# Altium project QR SCANNER.PrjPcb
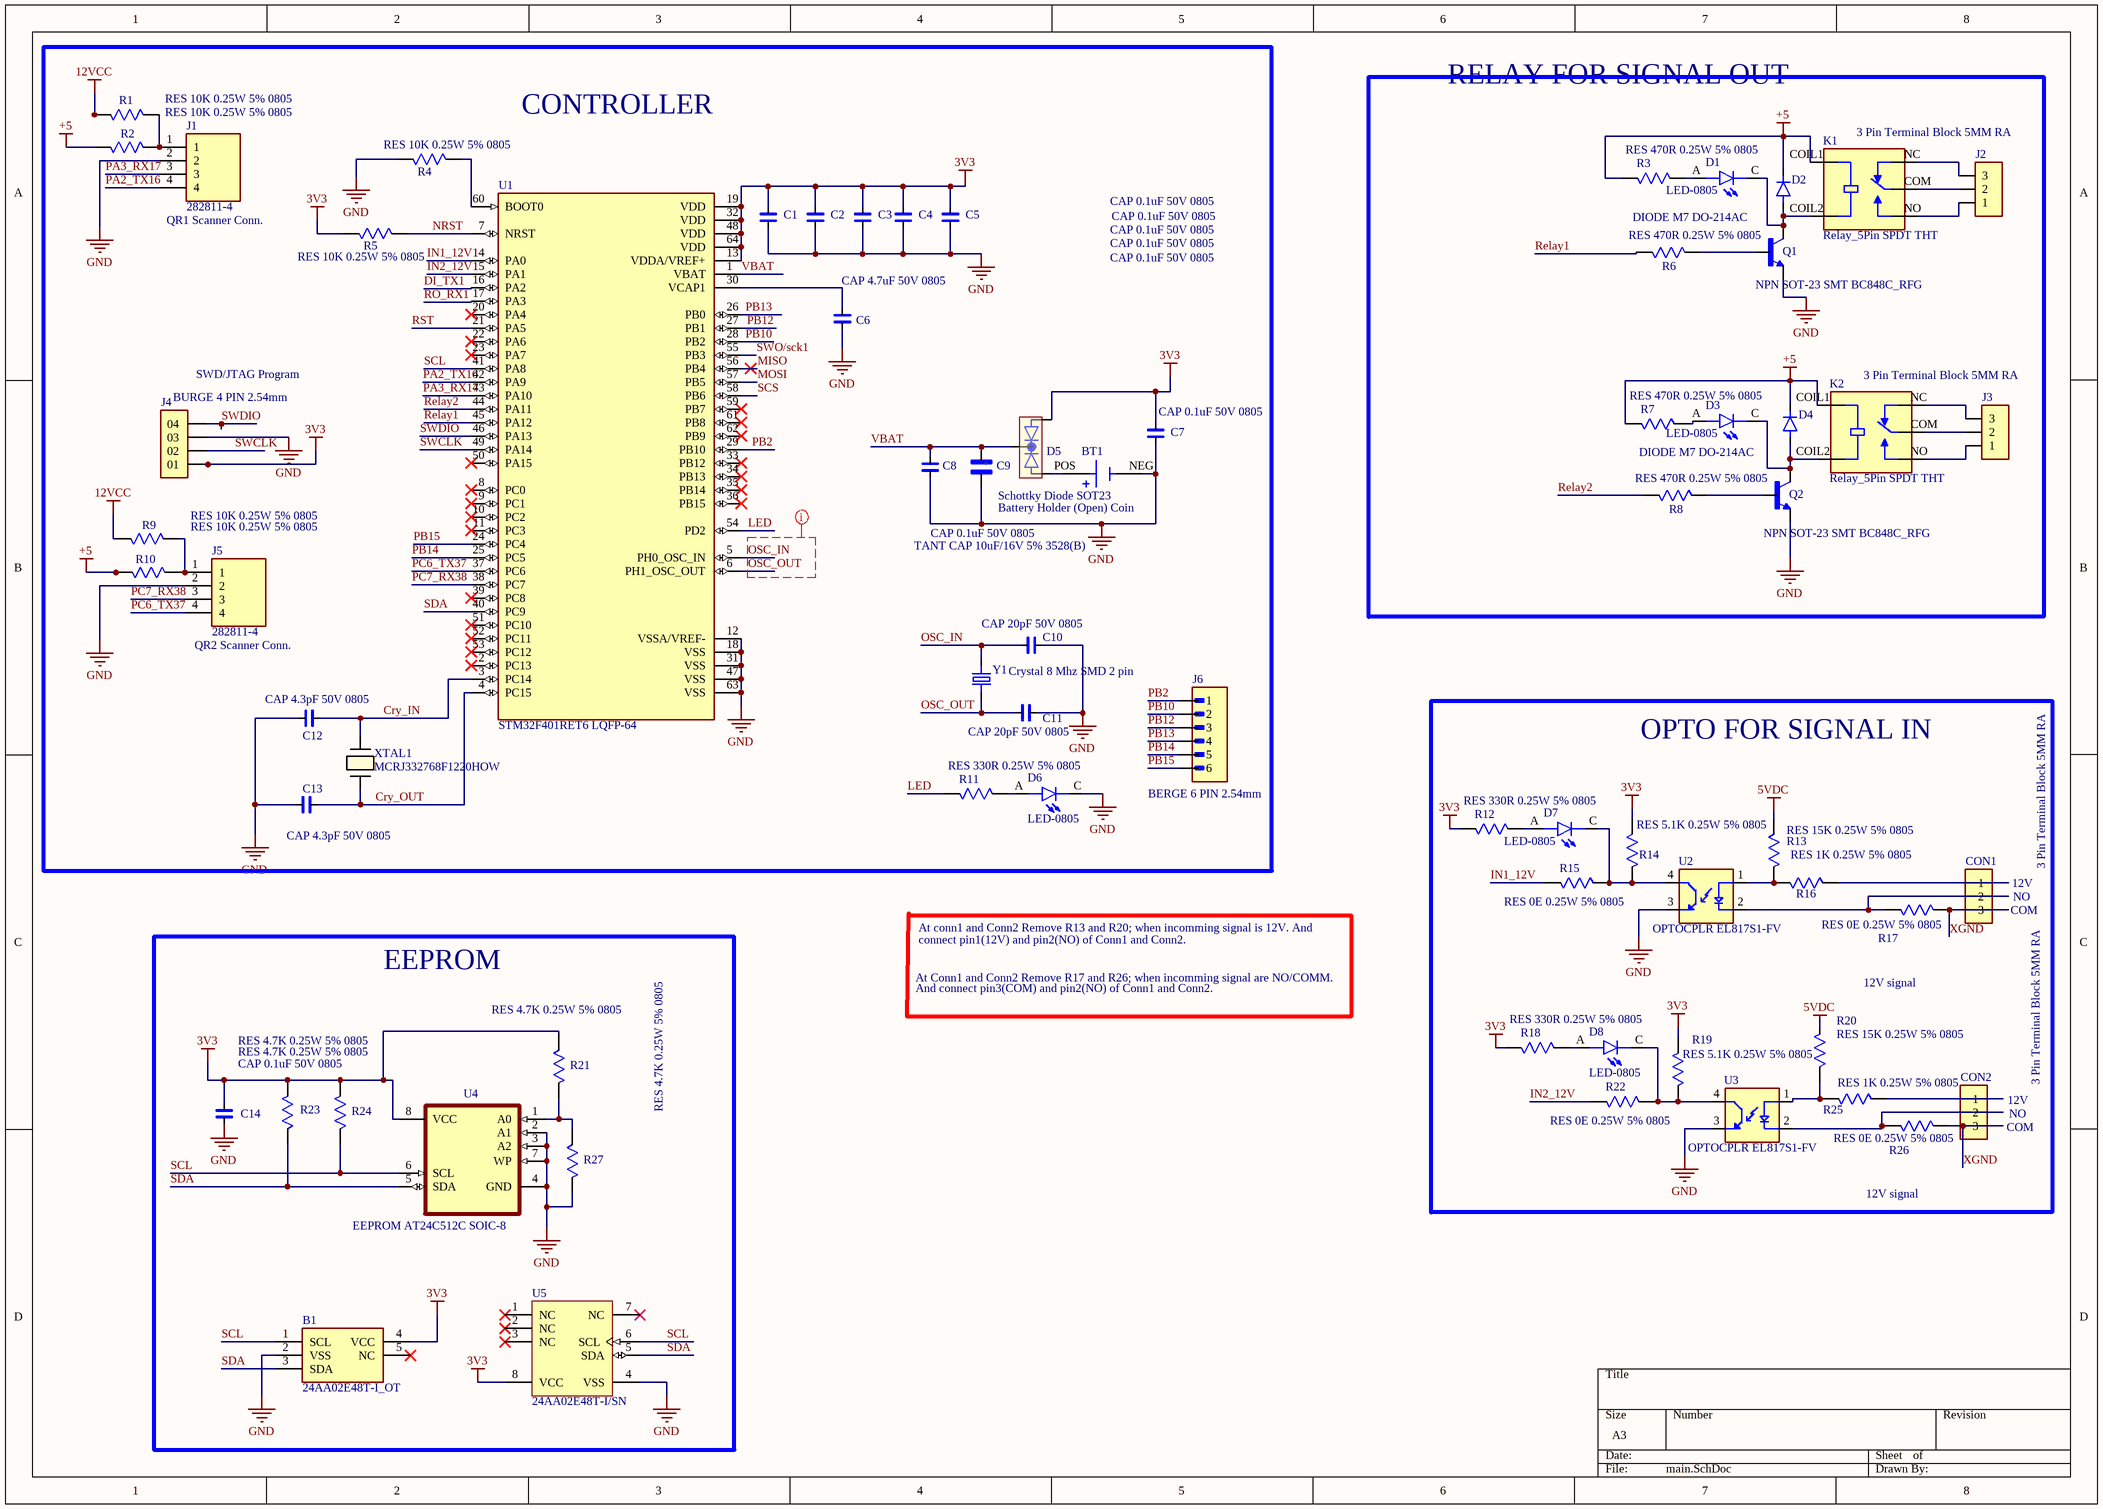
[diagram p0: main.SchDoc]
3 sheets, 158 parts. Net scope: global (net labels, ports and power ports of the same name join across sheets).
Board file: QR SCANNER NEW.PcbDoc
Sheets:
  main.SchDoc
  LAN 485.SchDoc
  Power.SchDoc

## Sheet main.SchDoc
size A3; SheetNumber: 1; SheetTotal: 3

### Parts
B1  24AA02E48T-I_OT  [SOT95P270X145-5N]
BT1  Battery Holder (Open) Coin  [Battery Holder (Open) Coin]
C1  CAP 0.1uF 50V 0805  [CAP CER 0.1uF/50V 5%]
C2  CAP 0.1uF 50V 0805  [CAP CER 0.1uF/50V 5%]
C3  CAP 0.1uF 50V 0805  [CAP CER 0.1uF/50V 5%]
C4  CAP 0.1uF 50V 0805  [CAP CER 0.1uF/50V 5%]
C5  CAP 0.1uF 50V 0805  [CAP CER 0.1uF/50V 5%]
C6  CAP 4.7uF 50V 0805  [CAP CER 0.1uF/50V 5%]
C7  CAP 0.1uF 50V 0805  [CAP CER 0.1uF/50V 5%]
C8  CAP 0.1uF 50V 0805  [CAP CER 0.1uF/50V 5%]
C9  TANT CAP 10uF/16V 5% 3528(B)  [TANT CAP 3528(B)]
C10  CAP 20pF 50V 0805  [CAP CER 0.1uF/50V 5%]
C11  CAP 20pF 50V 0805  [CAP CER 0.1uF/50V 5%]
C12  CAP 4.3pF 50V 0805  [CAP CER 0.1uF/50V 5%]
C13  CAP 4.3pF 50V 0805  [CAP CER 0.1uF/50V 5%]
C14  CAP 0.1uF 50V 0805  [CAP CER 0.1uF/50V 5%]
CON1  3 Pin Terminal Block 5MM RA  [3 Pin Terminal Block 5MM RA]
CON2  3 Pin Terminal Block 5MM RA  [3 Pin Terminal Block 5MM RA]
D1  LED-0805  [LED-0805]
D2  DIODE M7 DO-214AC  [DIODE M7 DO-214AC]
D3  LED-0805  [LED-0805]
D4  DIODE M7 DO-214AC  [DIODE M7 DO-214AC]
D5  Schottky Diode SOT23  [Schottky Diode SOT23 BAT54C]
D6  LED-0805  [LED-0805]
D7  LED-0805  [LED-0805]
D8  LED-0805  [LED-0805]
J1  282811-4  [TE_282811-4]
J2  3 Pin Terminal Block 5MM RA  [3 Pin Terminal Block 5MM RA]
J3  3 Pin Terminal Block 5MM RA  [3 Pin Terminal Block 5MM RA]
J4  BURGE 4 PIN 2.54mm  [BURGE 4 PIN 2.54mm]
J5  282811-4  [TE_282811-4]
J6  BERGE 6 PIN 2.54mm  [BERGE 6 PIN 2.54mm]
K1  Relay_5Pin SPDT THT  [Relay_5Pin SPDT THT]
K2  Relay_5Pin SPDT THT  [Relay_5Pin SPDT THT]
Q1  NPN SOT-23 SMT BC848C_RFG  [NPN SOT-23 SMT BC848C_RFG]
Q2  NPN SOT-23 SMT BC848C_RFG  [NPN SOT-23 SMT BC848C_RFG]
R1  RES 10K 0.25W 5% 0805  [RES 0805 10K/0.25W 5%]
R2  RES 10K 0.25W 5% 0805  [RES 0805 10K/0.25W 5%]
R3  RES 470R 0.25W 5% 0805  [RES 0805 10K/0.25W 5%]
R4  RES 10K 0.25W 5% 0805  [RES 0805 10K/0.25W 5%]
R5  RES 10K 0.25W 5% 0805  [RES 0805 10K/0.25W 5%]
R6  RES 470R 0.25W 5% 0805  [RES 0805 10K/0.25W 5%]
R7  RES 470R 0.25W 5% 0805  [RES 0805 10K/0.25W 5%]
R8  RES 470R 0.25W 5% 0805  [RES 0805 10K/0.25W 5%]
R9  RES 10K 0.25W 5% 0805  [RES 0805 10K/0.25W 5%]
R10  RES 10K 0.25W 5% 0805  [RES 0805 10K/0.25W 5%]
R11  RES 330R 0.25W 5% 0805  [RES 0805 10K/0.25W 5%]
R12  RES 330R 0.25W 5% 0805  [RES 0805 10K/0.25W 5%]
R13  RES 15K 0.25W 5% 0805  [RES 0805 10K/0.25W 5%]
R14  RES 5.1K 0.25W 5% 0805  [RES 0805 10K/0.25W 5%]
R15  RES 0E 0.25W 5% 0805  [RES 0805 10K/0.25W 5%]
R16  RES 1K 0.25W 5% 0805  [RES 0805 10K/0.25W 5%]
R17  RES 0E 0.25W 5% 0805  [RES 0805 10K/0.25W 5%]
R18  RES 330R 0.25W 5% 0805  [RES 0805 10K/0.25W 5%]
R19  RES 5.1K 0.25W 5% 0805  [RES 0805 10K/0.25W 5%]
R20  RES 15K 0.25W 5% 0805  [RES 0805 10K/0.25W 5%]
R21  RES 4.7K 0.25W 5% 0805  [RES 0805 10K/0.25W 5%]
R22  RES 0E 0.25W 5% 0805  [RES 0805 10K/0.25W 5%]
R23  RES 4.7K 0.25W 5% 0805  [RES 0805 10K/0.25W 5%]
R24  RES 4.7K 0.25W 5% 0805  [RES 0805 10K/0.25W 5%]
R25  RES 1K 0.25W 5% 0805  [RES 0805 10K/0.25W 5%]
R26  RES 0E 0.25W 5% 0805  [RES 0805 10K/0.25W 5%]
R27  RES 4.7K 0.25W 5% 0805  [RES 0805 10K/0.25W 5%]
U1  STM32F401RET6 LQFP-64  [STM32F401RE Cortex-M4]
U2  OPTOCPLR EL817S1-FV  [OPTOCPLR EL817S1-FV]
U3  OPTOCPLR EL817S1-FV  [OPTOCPLR EL817S1-FV]
U4  EEPROM AT24C512C SOIC-8  [EEPROM AT24C512C SOIC-8]
U5  24AA02E48T-I/SN  [SOIC-SN8_N]
XTAL1  MCRJ332768F1220HOW  [CRYSTAL_MCRJ332768F1220HOW_MTC]
Y1  Crystal 8 Mhz SMD 2 pin  [Crystal 16 Mhz SMD 2 pin]

### Blocks framed on the sheet
CONTROLLER: BT1 C1-C13 D5 D6 J1 J4-J6 R1 R2 R4 R5 R9-R11 U1 XTAL1 Y1
RELAY FOR SIGNAL OUT: D1-D4 J2 J3 K1 K2 Q1 Q2 R3 R6-R8
OPTO FOR SIGNAL IN: CON1 CON2 D7 D8 R12-R20 R22 R25 R26 U2 U3
EEPROM: B1 C14 R21 R23 R24 R27 U4 U5

### Nets
3V3: B1.4(VCC) C1.2 C2.2 C3.2 C4.2 C5.2 C7.2 C14.2 D5.1(A1) J4.01 R5.1 R12.2 R14.1 R18.2 R19.1 R21.2 R23.2 R24.2 U1.13(VDDA/VREF+) U1.19(VDD) U1.32(VDD) U1.48(VDD) U1.64(VDD) U4.8(VCC) U5.8(VCC)
5VDC: R13.1 R20.1
12VCC: R1.1 R9.1
+5: D2.C(K) D4.C(K) K1.COIL1 K2.COIL1 R2.1 R3.2 R7.2 R10.1
GND: B1.2(VSS) BT1.NEG C1.1 C2.1 C3.1 C4.1 C5.1 C6.1 C7.1 C8.1 C9.2 C10.2 C11.2 C12.2 C13.2 C14.1 D6.C J1.2 J4.03 J5.2 Q1.2(E) Q2.2(E) R4.1 R27.1 U1.12(VSSA/VREF-) U1.18(VSS) U1.31(VSS) U1.47(VSS) U1.63(VSS) U2.3(ET) U3.3(ET) U4.2(A1) U4.3(A2) U4.4(GND) U4.7(WP) U5.4(VSS)
Cry_IN: C12.1 U1.3(PC14) XTAL1.1
Cry_OUT: C13.1 U1.4(PC15) XTAL1.2
DI_TX1: U1.16(PA2)
IN1_12V: R15.2 U1.14(PA0)
IN2_12V: R22.2 U1.15(PA1)
LED: R11.2 U1.54(PD2)
MISO: U1.56(PB4)
MOSI: U1.57(PB5)
NRST: R5.2 U1.7(NRST)
OSC_IN: C10.1 U1.5(PH0_OSC_IN) Y1.2
OSC_OUT: C11.1 U1.6(PH1_OSC_OUT) Y1.1
PA2_TX16: J1.4 U1.42(PA9)
PA3_RX17: J1.3 U1.43(PA10)
PB2: J6.1 U1.29(PB10)
PB10: J6.2 U1.28(PB2)
PB12: J6.3 U1.27(PB1)
PB13: J6.4 U1.26(PB0)
PB14: J6.5 U1.25(PC5)
PB15: J6.6 U1.24(PC4)
PC6_TX37: J5.4 U1.37(PC6)
PC7_RX38: J5.3 U1.38(PC7)
Relay1: R6.1 U1.45(PA12)
Relay2: R8.1 U1.44(PA11)
RO_RX1: U1.17(PA3)
RST: U1.21(PA5)
SCL: B1.1(SCL) R24.1 U1.41(PA8) U4.6(SCL) U5.6(SCL)
SCS: U1.58(PB6)
SDA: B1.3(SDA) R23.1 U1.40(PC9) U4.5(SDA) U5.5(SDA)
SWCLK: J4.02 U1.49(PA14)
SWDIO: J4.04 U1.46(PA13)
SWO/sck1: U1.55(PB3)
VBAT: C8.2 C9.1 D5.3(C) U1.1(VBAT)
XGND: CON1.3 CON2.3 R17.1 R26.1
NetBT1_POS: BT1.POS D5.2(A2)
NetC6_2: C6.2 U1.30(VCAP1)
NetCON1_1: CON1.1 R16.1
NetCON1_2: CON1.2 R17.2 U2.2(C)
NetCON2_1: CON2.1 R25.1
NetCON2_2: CON2.2 R26.2 U3.2(C)
NetD1_A: D1.A R3.1
NetD1_C: D1.C D2.A K1.COIL2 Q1.3(C)
NetD3_A: D3.A R7.1
NetD3_C: D3.C D4.A K2.COIL2 Q2.3(C)
NetD6_A: D6.A R11.1
NetD7_A: D7.A R12.1
NetD7_C: D7.C R14.2 R15.1 U2.4(CT)
NetD8_A: D8.A R18.1
NetD8_C: D8.C R19.2 R22.1 U3.4(CT)
NetJ1_1: J1.1 R1.2 R2.2
NetJ2_1: J2.1 K1.NO
NetJ2_2: J2.2 K1.COM
NetJ2_3: J2.3 K1.NC
NetJ3_1: J3.1 K2.NO
NetJ3_2: J3.2 K2.COM
NetJ3_3: J3.3 K2.NC
NetJ5_1: J5.1 R9.2 R10.2
NetQ1_1: Q1.1(B) R6.2
NetQ2_1: Q2.1(B) R8.2
NetR4_2: R4.2 U1.60(BOOT0)
NetR13_2: R13.2 R16.2 U2.1(A)
NetR20_2: R20.2 R25.2 U3.1(A)
NetR21_1: R21.1 R27.2 U4.1(A0)

Not connected (* = marked no-connect by the designer): B1 5(NC)*; U1 2(PC13)* 8(PC0)* 9(PC1)* 10(PC2)* 11(PC3)* 20(PA4)* 22(PA6)* 23(PA7)* 33(PB12)* 34(PB13)* 35(PB14)* 36(PB15)* 39(PC8)* 50(PA15)* 51(PC10)* 52(PC11)* 53(PC12)* 59(PB7)* 61(PB8)* 62(PB9)*; U5 1(NC)* 2(NC)* 3(NC)* 7(NC)*

### Layout directives
net class Single_50 ohm: OSC_IN, OSC_OUT

### Notes on the sheet
- (near J1) QR1 Scanner Conn.
- (near J4) SWD/JTAG Program
- (near J5) QR2 Scanner Conn.
- (near CON1) COM
- (near CON1) 12V
- (near CON1) NO
- At Conn1 and Conn2 Remove R17 and R26; when incomming signal are NO/COMM.
- And connect pin3(COM) and pin2(NO) of Conn1 and Conn2.
- At conn1 and Conn2 Remove R13 and R20; when incomming signal is 12V. And
- connect pin1(12V) and pin2(NO) of Conn1 and Conn2.
- 12V signal
- (near CON2) 12V
- (near CON2) NO
- (near CON2) COM
- (in symbol TANT CAP 10uF/16V 5% 3528(B)) +

### Library data of the parts
B1 = 24AA02E48T-I_OT: 2K 256X8 1.8V Ser.EEPROM,24AA02E48T-I/OT; Manufacturer_Name: Microchip; Geometry.Height: 1.45mm; Manufacturer_Part_Number: 24AA02E48T-I/OT; Mouser Part Number: 579-24AA02E48TIOT; Mouser Price/Stock: https://www.mouser.co.uk/ProductDetail/Microchip-Technology/24AA02E48T-I-OT?qs=h8kCHL4kpM5dzsPTuTrxSQ%3D%3D; Arrow Part Number: 24AA02E48T-I/OT; Arrow Price/Stock: https://www.arrow.com/en/products/24aa02e48t-iot/microchip-technology?utm_currency=USD&region=nac; Datasheet Link: https://datasheet.datasheetarchive.com/originals/distributors/SFDatasheet-11/sf-000234844.pdf
BT1 = Battery Holder (Open) Coin: Battery Holder (Open) Coin, 20.0mm 1 Cell SMD (SMT) Tab, CR2032, BS-7-RED; Package: None; Price: None; Value: *; MP: BS-7-RED; Availability: Unavailable
C1-C8 C10-C14 = CAP CER 0.1uF/50V 5%: CAP CER 0.1uF/50V  Ceramic Capacitor X7R 0805 (2012 Metric) SMT; MF: Samsung; MP: CL21B104KCFNNNE; Purchase-URL: https://pricing.snapeda.com/search?q=CL21B104KCFNNNE&ref=eda; Package: 0805 Samsung; Check_prices: https://www.snapeda.com/parts/CL21B104KCFNNNE/Samsung+Electro-Mechanics/view-part/?ref=eda; Value: *; SnapEDA_Link: https://www.snapeda.com/parts/CL21B104KCFNNNE/Samsung+Electro-Mechanics/view-part/?ref=snap; Digi-Key_Part_Number: 1276-6840-2-ND
C9 = TANT CAP 10uF/16V 5% 3528(B): 10 ÂµF Molded Tantalum Polymer Capacitor 25 V 1411 (3528 Metric), 1210 150mOhm TCJB106M025R0150; MF: AVX; SnapEDA_Link: https://www.snapeda.com/parts/TCJB106M025R0150/AVX/view-part/?ref=snap; Package: 1210 AVX; Value: *; MP: TCJB106M025R0150; Check_prices: https://www.snapeda.com/parts/TCJB106M025R0150/AVX/view-part/?ref=eda
CON1 CON2 J2 J3 = 3 Pin Terminal Block 5MM RA: 3 Pin Terminal Block HDR 5MM THT RA 231-433_001-000; MP: 231-433/001-000; MF: WAGO; SnapEDA_Link: https://www.snapeda.com/parts/231-433/001-000/WAGO/view-part/482062/?ref=snap; Package: None; Availability: Unavailable; Price: None; Value: *
D1 D3 D6-D8 = LED-0805: Red 640nm LED Indication - Discrete 1.85V 0805 (2012 Metric) APT2012SRCPRV; MF: Kingbright; SnapEDA_Link: https://www.snapeda.com/parts/APT2012SRCPRV/Kingbright/view-part/?ref=snap; Package: 0805 Kingbright; Value: *; MP: APT2012SRCPRV; Check_prices: https://www.snapeda.com/parts/APT2012SRCPRV/Kingbright/view-part/?ref=eda
D2 D4 = DIODE M7 DO-214AC: M7 General Purpose SMD Rectifier Diode SMA (DO-214AC) 1A 1000V 1n4007 RS2MA; MF: Taiwan Semiconductor; SnapEDA_Link: https://www.snapeda.com/parts/RS2MA/Taiwan+Semiconductor/view-part/?ref=snap; Package: DO-214AC-2 Taiwan Semiconductor; Value: *; MP: RS2MA; Check_prices: https://www.snapeda.com/parts/RS2MA/Taiwan+Semiconductor/view-part/?ref=eda
D5 = Schottky Diode SOT23 BAT54C: Schottky Diode 2x ComCath 0.2A 30V SOT23 | Diodes Inc BAT54C; MF: Diodes Inc.; MP: BAT54C-7-F; SnapEDA_Link: https://www.snapeda.com/parts/BAT54C-7-F/Diodes+Inc./view-part/?ref=snap; Package: SOT-23 Diodes Inc.; Value: *; Check_prices: https://www.snapeda.com/parts/BAT54C-7-F/Diodes+Inc./view-part/?ref=eda
J1 J5 = 282811-4: 4 Position Terminal Block Header, Male Pins, Shrouded (2 Side) 0.197 (5.00mm) 90Â°, Right Angle Through Hole; Centerline_Pitch: 5 mm[.197 in]; MF: TE Connectivity; Number_of_Positions: 4; SnapEDA_Link: https://www.snapeda.com/parts/282811-4/TE%20Connectivity%20AMP%20Connectors/view-part/2383458/?ref=snap; Price: None; Mouser-Purchase-URL: https://snapeda.com/shop?store=Mouser&id=2383458; DigiKey-Purchase-URL: https://snapeda.com/shop?store=DigiKey&id=2383458; Value: *; MP: 282811-4; Package: None; EU_RoHS_Compliance: Compliant; Availability: Good
J4 = BURGE 4 PIN 2.54mm: Conn Unshrouded Header HDR 4 POS 2.54mm Solder ST Top Entry Thru-Hole Bulk TSW-104-17-G-S-LL; MF: Samtec; MP: TSW-104-23-H-S-LL; SnapEDA_Link: https://www.snapeda.com/parts/TSW-104-23-H-S-LL/Samtec/view-part/?ref=snap; Package: None; Value: *; Check_prices: https://www.snapeda.com/parts/TSW-104-23-H-S-LL/Samtec/view-part/?ref=eda
J6 = BERGE 6 PIN 2.54mm: BergStik, Board to Board connector, Unshrouded Vertical Header, Through Hole, Single Row, 6 Positions, 2.54 mm (0.100in) Pitch. 68604-406HLF; MF: AMPHENOL ICC / FCI; SnapEDA_Link: https://www.snapeda.com/parts/68604-406HLF/Amphenol/view-part/?ref=snap; Package: None; Value: *; MP: 68604-406HLF; Check_prices: https://www.snapeda.com/parts/68604-406HLF/Amphenol/view-part/?ref=eda
K1 K2 = Relay_5Pin SPDT THT: Relays General Purpose Non Latching 3VDC SPDT 10A (250VAC) Max 5PIN SRD-03VDC-SL-C; MF: Songle Relay; SnapEDA_Link: https://www.snapeda.com/parts/SRD-03VDC-SL-C/Songle+Relay/view-part/?ref=snap; Package: NON STANDARD-5 Songle Relay; Value: *; MP: SRD-03VDC-SL-C; Check_prices: https://www.snapeda.com/parts/SRD-03VDC-SL-C/Songle+Relay/view-part/?ref=eda
Q1 Q2 = NPN SOT-23 SMT BC848C_RFG: NPN SMT BC848C_RFG SOT-23, 30V, 0.1A, NPN Transistor; MF: Taiwan Semiconductor; MP: BC848C RFG; SnapEDA_Link: https://www.snapeda.com/parts/BC848C%20RFG/Taiwan+Semiconductor/view-part/?ref=snap; Package: SOT-23 Taiwan Semiconductor; Value: *; Check_prices: https://www.snapeda.com/parts/BC848C%20RFG/Taiwan+Semiconductor/view-part/?ref=eda
R1-R27 = RES 10K 0.25W 5% 0805: RESISTOR, THICK FILM, 10K, 5%, 0805 0.25W SMT; MP: ERJ-6GEYJ103V; MF: Panasonic Electronic; Price: None; Check_prices: https://www.snapeda.com/parts/ERJ-6GEYJ103V/Panasonic+Electronic+Components/view-part/?ref=eda; Package: 805-2 Panasonic; Purchase-URL: https://pricing.snapeda.com/search/part/ERJ-6GEYJ103V/?ref=eda; Availability: In Stock; SnapEDA_Link: https://www.snapeda.com/parts/ERJ-6GEYJ103V/Panasonic+Electronic+Components/view-part/?ref=snap; Value: *
U1 = STM32F401RET6: ARMÂ® CortexÂ®-M4 STM32F4 Microcontroller IC 32-Bit Single-Core 84MHz 512KB (512K x 8) FLASH 64-LQFP (10x10); MF: STMicroelectronics; SnapEDA_Link: https://www.snapeda.com/parts/STM32F401RET6/STMicroelectronics/view-part/?ref=snap; Package: LQFP-64 STMicroelectronics; Value: *; MP: STM32F401RET6; Check_prices: https://www.snapeda.com/parts/STM32F401RET6/STMicroelectronics/view-part/?ref=eda
U2 U3 = Optclr EL817S1-FV: Optoisoltr 5kv Transistor 4-Smd EL817S1-FV; MF: {'manufacturer': u'Everlight Electronics Co Ltd'}; MP: EL817S1(A)(TU)-V; Package: None; Price: None; Value: *; Availability: Unavailable
U4 = EEPROM AT24C512C SOIC-8: EEPROM Memory IC 512Kb (64K x 8) IÂ²C 400 kHz 900 ns SOIC-8 AT24C512C-SSHM-T; MF: Microchip; SnapEDA_Link: https://www.snapeda.com/parts/AT24C512C-SSHM-T/Microchip/view-part/?ref=snap; Package: SO-8 Microchip; Value: *; MP: AT24C512C-SSHM-T; Check_prices: https://www.snapeda.com/parts/AT24C512C-SSHM-T/Microchip/view-part/?ref=eda
U5 = CMP-0159-00177-1: 2Kbit, 400kHz, 1.7V, I2C Serial EEPROM with EUI-48 Node Identity, 8-Pin SOIC 150mil, Industrial Temperature, Tape and Reel; PackageReference: SOIC-SN8; DatasheetVersion: revB, Jan-2009; PackageDescription: 8-Lead Plastic Small Outline (SN) - Narrow, 3.90mm Body [SOIC]; PackageVersion: revBB, Aug-2009; Code_IPC: SOIC127P600-8; Code_JEDEC: MS-012
XTAL1 = MCRJ332768F1220HOW: No Description Available; Manufacturer_Name: Multicomp; Copyright: Copyright (C) 2026 Ultra Librarian. All rights reserved.; Manufacturer_Part_Number: MCRJ332768F1220HOW
Y1 = Crystal 16 Mhz SMD 2 pin_1: 16 MHz Â±30ppm Crystal 20pF 60 Ohms HC-49/US FOXSDLF/128-20 16 Mhz Crystal SMD –CSM-4ALX(28ALX) 12.5mmX4.85mmX4mm; MF: Fox Electronics; SnapEDA_Link: https://www.snapeda.com/parts/FOXSDLF/128-20/Fox+Electronics/view-part/?ref=snap; Package: HC49SD Fox Electronics; Value: *; MP: FOXSDLF/128-20; Check_prices: https://www.snapeda.com/parts/FOXSDLF/128-20/Fox+Electronics/view-part/?ref=eda

## Sheet LAN 485.SchDoc
size A3; SheetNumber: 2; SheetTotal: 3
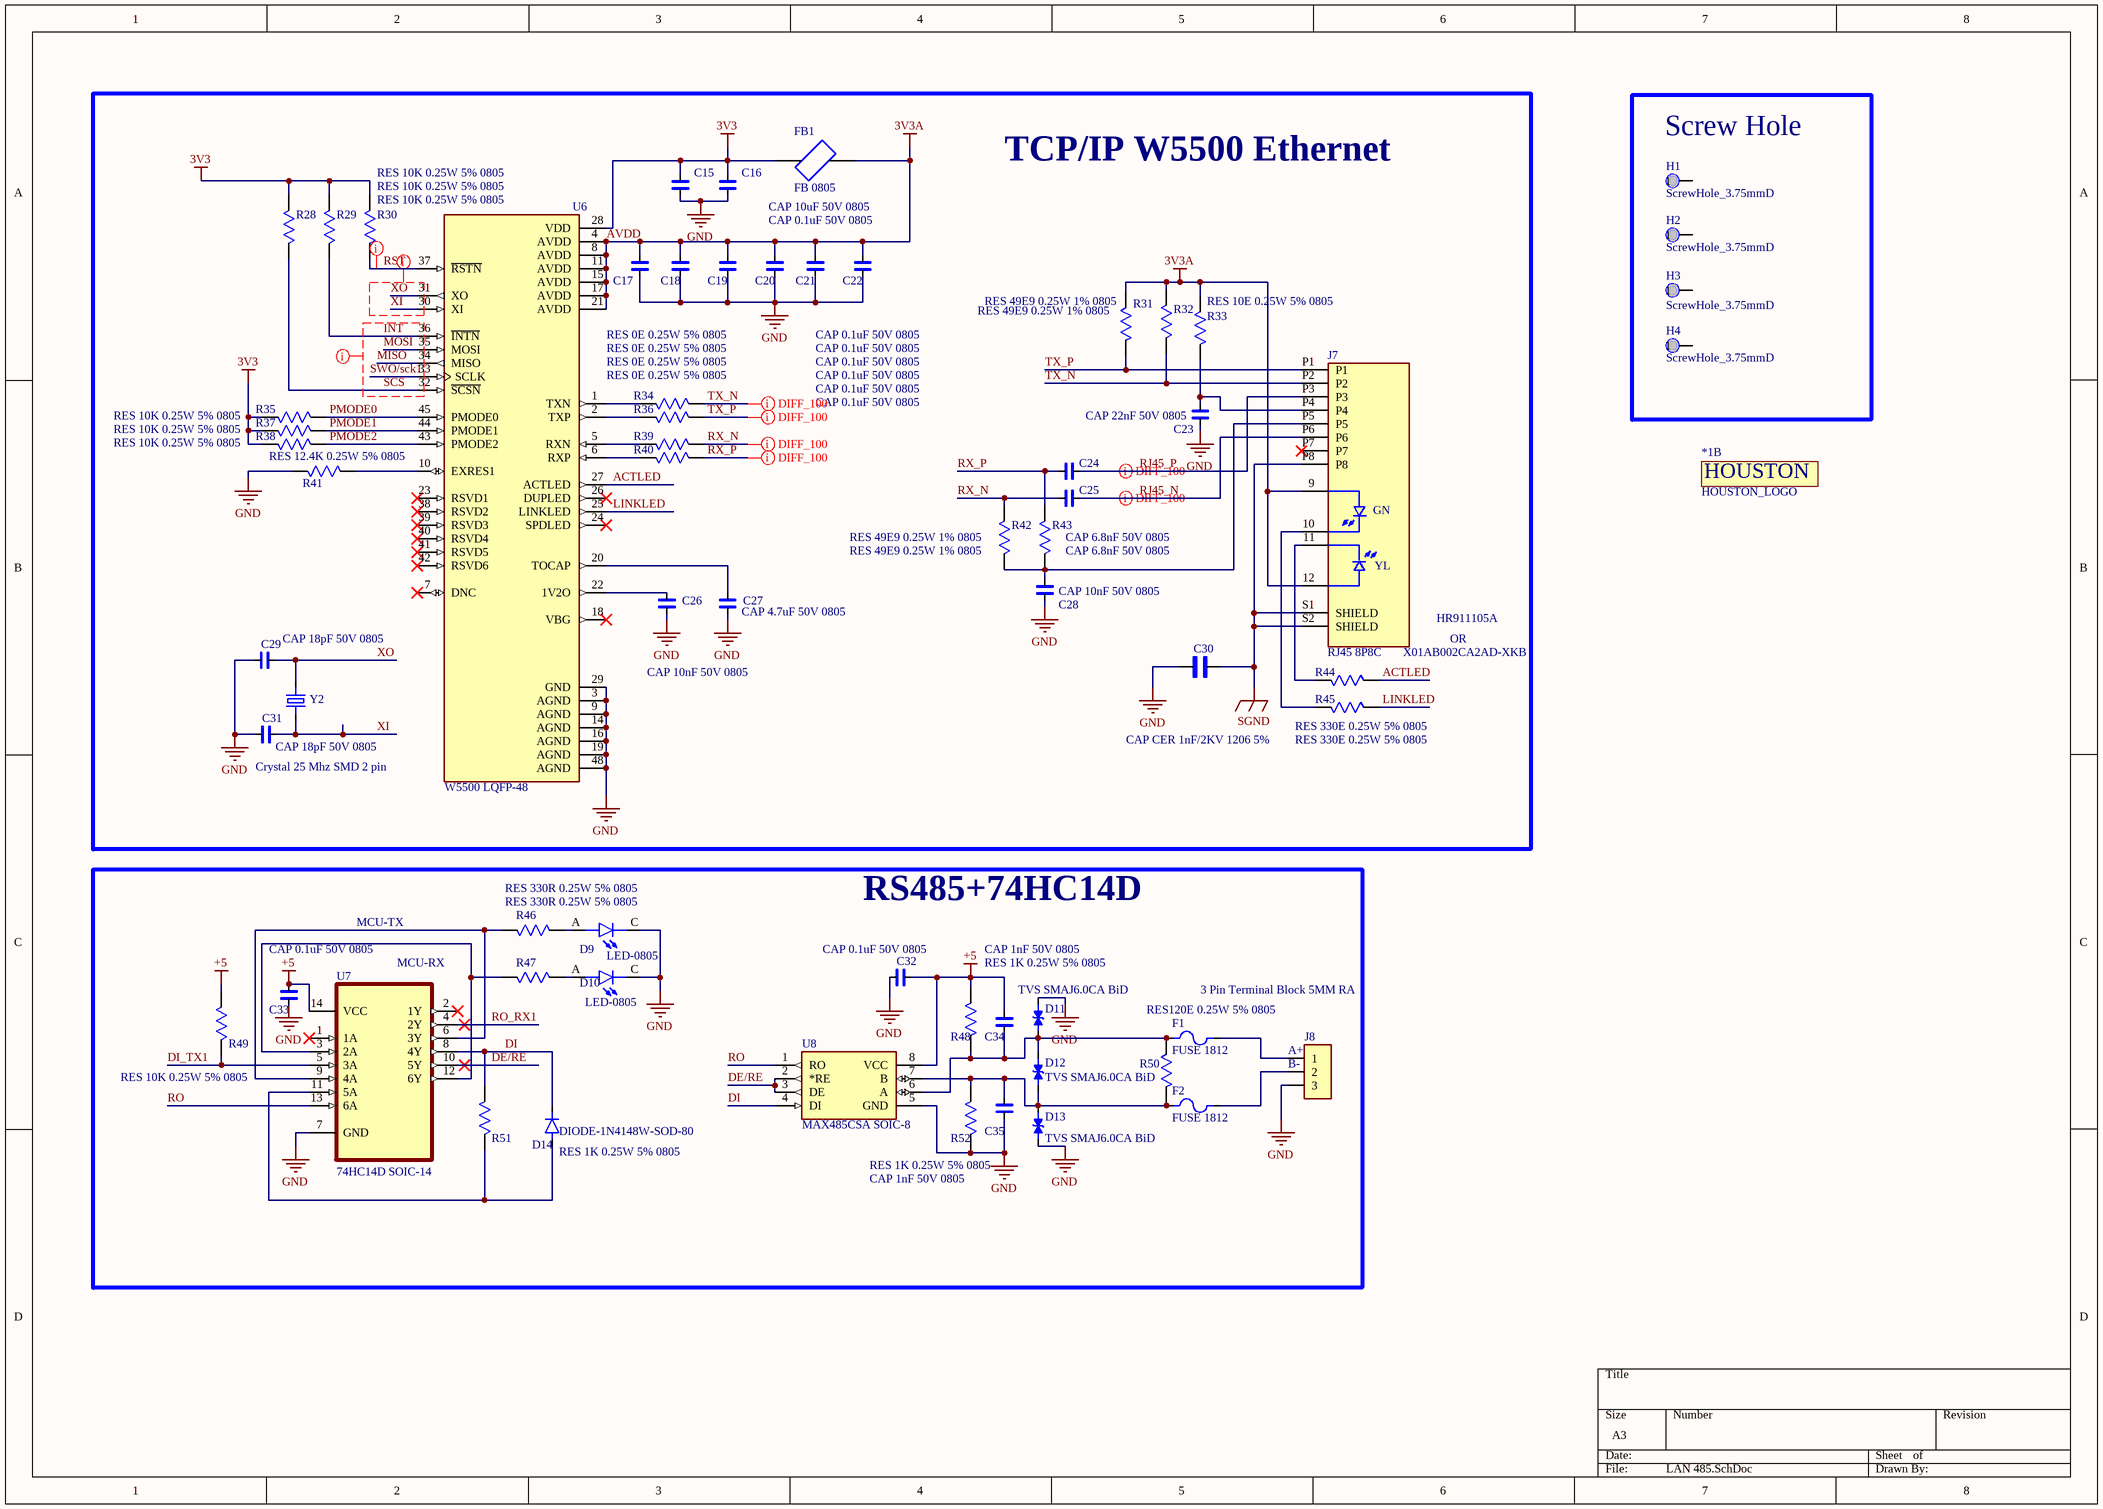
[diagram p1: LAN 485.SchDoc]

### Parts
*1  HOUSTON_LOGO  [HOUSTON_LOGO]  (part B of 2)
C15  CAP 0.1uF 50V 0805  [CAP CER 0.1uF/50V 5%]
C16  CAP 10uF 50V 0805  [CAP CER 0.1uF/50V 5%]
C17  CAP 0.1uF 50V 0805  [CAP CER 0.1uF/50V 5%]
C18  CAP 0.1uF 50V 0805  [CAP CER 0.1uF/50V 5%]
C19  CAP 0.1uF 50V 0805  [CAP CER 0.1uF/50V 5%]
C20  CAP 0.1uF 50V 0805  [CAP CER 0.1uF/50V 5%]
C21  CAP 0.1uF 50V 0805  [CAP CER 0.1uF/50V 5%]
C22  CAP 0.1uF 50V 0805  [CAP CER 0.1uF/50V 5%]
C23  CAP 22nF 50V 0805  [CAP CER 0.1uF/50V 5%]
C24  CAP 6.8nF 50V 0805  [CAP CER 0.1uF/50V 5%]
C25  CAP 6.8nF 50V 0805  [CAP CER 0.1uF/50V 5%]
C26  CAP 10nF 50V 0805  [CAP CER 0.1uF/50V 5%]
C27  CAP 4.7uF 50V 0805  [CAP CER 0.1uF/50V 5%]
C28  CAP 10nF 50V 0805  [CAP CER 0.1uF/50V 5%]
C29  CAP 18pF 50V 0805  [CAP CER 0.1uF/50V 5%]
C30  CAP CER 1nF/2KV 1206 5%  [CAP CER 1nF/2KV 1206 5%]
C31  CAP 18pF 50V 0805  [CAP CER 0.1uF/50V 5%]
C32  CAP 0.1uF 50V 0805  [CAP CER 0.1uF/50V 5%]
C33  CAP 0.1uF 50V 0805  [CAP CER 0.1uF/50V 5%]
C34  CAP 1nF 50V 0805  [CAP CER 0.1uF/50V 5%]
C35  CAP 1nF 50V 0805  [CAP CER 0.1uF/50V 5%]
D9  LED-0805  [LED-0805]
D10  LED-0805  [LED-0805]
D11  TVS SMAJ6.0CA BiD  [TVS SMAJ6.0CA DO-214AC (SMA)]
D12  TVS SMAJ6.0CA BiD  [TVS SMAJ6.0CA DO-214AC (SMA)]
D13  TVS SMAJ6.0CA BiD  [TVS SMAJ6.0CA DO-214AC (SMA)]
D14  DIODE-1N4148W-SOD-80  [DIODE-1N4148W-SOD-80]
F1  FUSE 1812  [FUSE 1812]
F2  FUSE 1812  [FUSE 1812]
FB1  FB 0805  [FB 0805]
H1  ScrewHole_3.75mmD  [ScrewHole_3.75mmD - duplicate]
H2  ScrewHole_3.75mmD  [ScrewHole_3.75mmD - duplicate]
H3  ScrewHole_3.75mmD  [ScrewHole_3.75mmD - duplicate]
H4  ScrewHole_3.75mmD  [ScrewHole_3.75mmD - duplicate]
J7  RJ45 8P8C  [RJ45 8P8C]
J8  3 Pin Terminal Block 5MM RA  [3 Pin Terminal Block 5MM RA]
R28  RES 10K 0.25W 5% 0805  [RES 0805 10K/0.25W 5%]
R29  RES 10K 0.25W 5% 0805  [RES 0805 10K/0.25W 5%]
R30  RES 10K 0.25W 5% 0805  [RES 0805 10K/0.25W 5%]
R31  RES 49E9 0.25W 1% 0805  [RES 0805 10K/0.25W 5%]
R32  RES 49E9 0.25W 1% 0805  [RES 0805 10K/0.25W 5%]
R33  RES 10E 0.25W 5% 0805  [RES 0805 10K/0.25W 5%]
R34  RES 0E 0.25W 5% 0805  [RES 0805 10K/0.25W 5%]
R35  RES 10K 0.25W 5% 0805  [RES 0805 10K/0.25W 5%]
R36  RES 0E 0.25W 5% 0805  [RES 0805 10K/0.25W 5%]
R37  RES 10K 0.25W 5% 0805  [RES 0805 10K/0.25W 5%]
R38  RES 10K 0.25W 5% 0805  [RES 0805 10K/0.25W 5%]
R39  RES 0E 0.25W 5% 0805  [RES 0805 10K/0.25W 5%]
R40  RES 0E 0.25W 5% 0805  [RES 0805 10K/0.25W 5%]
R41  RES 12.4K 0.25W 5% 0805  [RES 0805 10K/0.25W 5%]
R42  RES 49E9 0.25W 1% 0805  [RES 0805 10K/0.25W 5%]
R43  RES 49E9 0.25W 1% 0805  [RES 0805 10K/0.25W 5%]
R44  RES 330E 0.25W 5% 0805  [RES 0805 10K/0.25W 5%]
R45  RES 330E 0.25W 5% 0805  [RES 0805 10K/0.25W 5%]
R46  RES 330R 0.25W 5% 0805  [RES 0805 10K/0.25W 5%]
R47  RES 330R 0.25W 5% 0805  [RES 0805 10K/0.25W 5%]
R48  RES 1K 0.25W 5% 0805  [RES 0805 10K/0.25W 5%]
R49  RES 10K 0.25W 5% 0805  [RES 0805 10K/0.25W 5%]
R50  RES120E 0.25W 5% 0805  [RES 0805 10K/0.25W 5%]
R51  RES 1K 0.25W 5% 0805  [RES 0805 10K/0.25W 5%]
R52  RES 1K 0.25W 5% 0805  [RES 0805 10K/0.25W 5%]
U6  W5500 LQFP-48  [W5500 LQFP-48]
U7  74HC14D SOIC-14  [74HC14D SOIC-14]
U8  MAX485CSA SOIC-8  [MAX485CSA]
Y2  Crystal 25 Mhz SMD 2 pin  [Crystal 16 Mhz SMD 2 pin]

### Blocks framed on the sheet
TCP/IP W5500 Ethernet: C15-C31 FB1 J7 R28-R45 U6 Y2
Screw Hole: H1-H4
RS485+74HC14D: C32-C35 D9-D14 F1 F2 J8 R46-R52 U7 U8

### Nets
3V3: C15.2 C16.2 FB1.1 R28.2 R29.2 R30.2 R35.2 R37.2 R38.2 U6.28(VDD)
+5: C32.1 C33.2 C34.2 R48.1 R49.2 U7.14(VCC) U8.8(VCC)
AVDD: C17.2 C18.2 C19.2 C20.2 C21.2 C22.2 FB1.2 J7.9 J7.12 R31.2 R32.2 R33.2 U6.4(AVDD) U6.8(AVDD) U6.11(AVDD) U6.15(AVDD) U6.17(AVDD) U6.21(AVDD)  [also labelled 3V3A]
GND: C15.1 C16.1 C17.1 C18.1 C19.1 C20.1 C21.1 C22.1 C23.1 C26.1 C27.1 C28.1 C29.2 C30.1 C31.2 C32.2 C33.1 C35.2 D9.C D10.C D11.2 D13.1 J8.3 R41.1 R52.1 U6.3(AGND) U6.9(AGND) U6.14(AGND) U6.16(AGND) U6.19(AGND) U6.29(GND) U6.48(AGND) U7.7(GND) U8.5(GND)
SGND: C30.2 J7.P8 J7.S1(SHIELD) J7.S2(SHIELD)
ACTLED: R44.1 U6.27(ACTLED)
DE/RE: U7.10(5Y) U8.2(*RE) U8.3(DE)
DI: D14.C(K) R51.2 U7.8(4Y) U8.4(DI)
DI_TX1: R49.1 U7.5(3A)
INT: R29.1 U6.36(~{INTN})
LINKLED: R45.1 U6.25(LINKLED)
MISO: U6.34(MISO)
MOSI: U6.35(MOSI)
PMODE0: R35.1 U6.45(PMODE0)
PMODE1: R37.1 U6.44(PMODE1)
PMODE2: R38.1 U6.43(PMODE2)
RJ45_N: C25.1 J7.P6
RJ45_P: C24.1 J7.P3
RO: U7.13(6A) U8.1(RO)
RO_RX1: U7.4(2Y)
RST: R30.1 U6.37(~{RSTN})
RX_N: C25.2 R39.1 R42.2
RX_P: C24.2 R40.1 R43.2
SCS: R28.1 U6.32(~{SCSN})
SWO/sck1: U6.33(SCLK)
TX_N: J7.P2 R32.1 R34.1
TX_P: J7.P1 R31.1 R36.1
XI: C31.1 U6.30(XI) Y2.2
XO: C29.1 U6.31(XO) Y2.1
NetC23_2: C23.2 J7.P4 R33.1
NetC26_2: C26.2 U6.22(1V2O)
NetC27_2: C27.2 U6.20(TOCAP)
NetC28_2: C28.2 J7.P5 R42.1 R43.1
NetC34_1: C34.1 D11.1 D12.2 F1.1 R48.2 R50.2 U8.6(A)
NetC35_1: C35.1 D12.1 D13.2 F2.1 R50.1 R52.2 U8.7(B)
NetD9_A: D9.A R46.1
NetD10_A: D10.A R47.1
NetD14_A: D14.A R51.1 U7.11(5A)
NetF1_2: F1.2 J8.1
NetF2_2: F2.2 J8.2
NetJ7_10: J7.10 R45.2
NetJ7_11: J7.11 R44.2
NetR34_2: R34.2 U6.1(TXN)
NetR36_2: R36.2 U6.2(TXP)
NetR39_2: R39.2 U6.5(RXN)
NetR40_2: R40.2 U6.6(RXP)
NetR41_2: R41.2 U6.10(EXRES1)
NetR46_2: R46.2 U7.6(3Y) U7.9(4A)
NetR47_2: R47.2 U7.3(2A) U7.12(6Y)

Not connected (* = marked no-connect by the designer): H1 1; H2 1; H3 1; H4 1; J7 P7*; U6 7(DNC)* 18(VBG)* 23(RSVD1)* 24(SPDLED)* 26(DUPLED)* 38(RSVD2)* 39(RSVD3)* 40(RSVD4)* 41(RSVD5)* 42(RSVD6)*; U7 1(1A)* 2(1Y)*

### Layout directives
net class Single_50 ohm: INT, MISO, MOSI, RST, SCS, SWO/sck1, XI, XO
differential pair; differential pair class DIFF_100: RJ45_N, RJ45_P, RX_N, RX_P, TX_N, TX_P

### Notes on the sheet
- HR911105A
- OR
- X01AB002CA2AD-XKB
- MCU-TX
- (near U7) MCU-RX
- (near J8) A+
- (near J8) B-
- (in symbol HOUSTON_LOGO, part B) HOUSTON
- (in symbol RJ45 8P8C) GN; YL

### Library data of the parts
C15-C29 C31-C35 = CAP CER 0.1uF/50V 5%: as C1 on sheet main; Purchase-URL: https://pricing.snapeda.com/search?q=CL21B104KCFNNNE&ref=eda; Package: 0805 Samsung; Check_prices: https://www.snapeda.com/parts/CL21B104KCFNNNE/Samsung+Electro-Mechanics/view-part/?ref=eda; Value: *; SnapEDA_Link: https://www.snapeda.com/parts/CL21B104KCFNNNE/Samsung+Electro-Mechanics/view-part/?ref=snap; Digi-Key_Part_Number: 1276-6840-2-ND
C30 = CAP CER 1nF/2KV 1206 5%: 1000 pF Â±10% 2000V (2kV) Ceramic Capacitor X7R 1206 (3216 Metric) C1206C102KGRACAUTO; MF: KEMET; SnapEDA_Link: https://www.snapeda.com/parts/C1206C102KGRACAUTO/KEMET/view-part/?ref=snap; Package: 3216 KEMET; Value: *; MP: C1206C102KGRACAUTO; Check_prices: https://www.snapeda.com/parts/C1206C102KGRACAUTO/KEMET/view-part/?ref=eda
D9 D10 = LED-0805: as D1 on sheet main; SnapEDA_Link: https://www.snapeda.com/parts/APT2012SRCPRV/Kingbright/view-part/?ref=snap; Package: 0805 Kingbright; Value: *; MP: APT2012SRCPRV; Check_prices: https://www.snapeda.com/parts/APT2012SRCPRV/Kingbright/view-part/?ref=eda
D11-D13 = TVS SMAJ6.0CA DO-214AC (SMA): SMAJ6.0CA WG Bidirectional TVS diode littlefuse DO-214AC (SMA); MP: SMAJ7.5CA; Availability: Unavailable; Package: None; Value: *; Price: None
D14 = DIODE-1N4148W-SOD-80: DIODE-1N4148W-SOD-80 is a general-purpose silicon diode LL4148_L1G; MP: LL4148_L1G; Price: None; Package: None; Availability: Unavailable; Value: *
F1 F2 = FUSE 1812: Polymeric PTC Resettable Fuse 60V 100 mA Ih Surface Mount 1812 (4532 Metric), Concave, MF-MSMF010-2; MF: Bourns; Price: None; Availability: In Stock; MP: MF-MSMF010-2; Package: 1812 Bourns; SnapEDA_Link: https://www.snapeda.com/parts/MF-MSMF010-2/Bourns/view-part/?ref=snap; Check_prices: https://www.snapeda.com/parts/MF-MSMF010-2/Bourns/view-part/?ref=eda; Value: *; Purchase-URL: https://pricing.snapeda.com/search/part/MF-MSMF010-2/?ref=eda
FB1 = FB 0805: MH2029-101Y-Bourns Inc.-Ferrite Bead, 100 Ohms @ 100 MHz , Signal Line Ferrite Bead 0805 (2012 Metric) 2A 100mOhm; MP: MPZ2012S102AT000; Package: None; Price: None; Value: *; Availability: Unavailable
H1-H4 = ScrewHole_3.75mmD: SCREW HEAD DIA 4.5MM, SREW LEG DIA 3 MM
J7 = RJ45 8P8C: 10/100 BaseT, 8P8C, Horizontal, Shielded, LED, Through Hole, 6 Âµin Plating, RJ45 with Integrated Magnetics Modular Connector CRJ011-ML1-TH; MF: Same Sky; SnapEDA_Link: https://www.snapeda.com/parts/CRJ011-ML1-TH/Same+Sky/view-part/?ref=snap; Package: None; Value: *; MP: CRJ011-ML1-TH; Check_prices: https://www.snapeda.com/parts/CRJ011-ML1-TH/Same+Sky/view-part/?ref=eda
J8 = 3 Pin Terminal Block 5MM RA: as CON1 on sheet main; SnapEDA_Link: https://www.snapeda.com/parts/231-433/001-000/WAGO/view-part/482062/?ref=snap; Package: None; Availability: Unavailable; Price: None; Value: *
R28-R52 = RES 10K 0.25W 5% 0805: as R1 on sheet main; Price: None; Check_prices: https://www.snapeda.com/parts/ERJ-6GEYJ103V/Panasonic+Electronic+Components/view-part/?ref=eda; Package: 805-2 Panasonic; Purchase-URL: https://pricing.snapeda.com/search/part/ERJ-6GEYJ103V/?ref=eda; Availability: In Stock; SnapEDA_Link: https://www.snapeda.com/parts/ERJ-6GEYJ103V/Panasonic+Electronic+Components/view-part/?ref=snap; Value: *
U6 = W5500: W5500 LQFP-48 Hardwired TCP/IP embedded Ethernet controller; Availability: Unavailable; MP: W5500; Value: *; Price: None; Package: None
U7 = 74HC14D,653: Inverter IC 6 Channel Schmitt Trigger 14-SO/SOIC-14; MF: Nexperia USA; SnapEDA_Link: https://www.snapeda.com/parts/74HC14D,653/Nexperia/view-part/?ref=snap; Package: SO14-14 Nexperia USA Inc.; Value: *; MP: 74HC14D,653; Check_prices: https://www.snapeda.com/parts/74HC14D,653/Nexperia/view-part/?ref=eda
U8 = MAX485CSA: MAX485CSA-RS-485/RS-422 Transceivers, SOIC-8; MF: Analog Devices; MP: MAX485CSA+; SnapEDA_Link: https://www.snapeda.com/parts/MAX485CSA+/Analog+Devices/view-part/?ref=snap; Package: SOIC-8 Maxim; Value: *; Check_prices: https://www.snapeda.com/parts/MAX485CSA+/Analog+Devices/view-part/?ref=eda
Y2 = Crystal 16 Mhz SMD 2 pin_1: as Y1 on sheet main; SnapEDA_Link: https://www.snapeda.com/parts/FOXSDLF/128-20/Fox+Electronics/view-part/?ref=snap; Package: HC49SD Fox Electronics; Value: *; MP: FOXSDLF/128-20; Check_prices: https://www.snapeda.com/parts/FOXSDLF/128-20/Fox+Electronics/view-part/?ref=eda

## Sheet Power.SchDoc
size A3; SheetNumber: 3; SheetTotal: 3
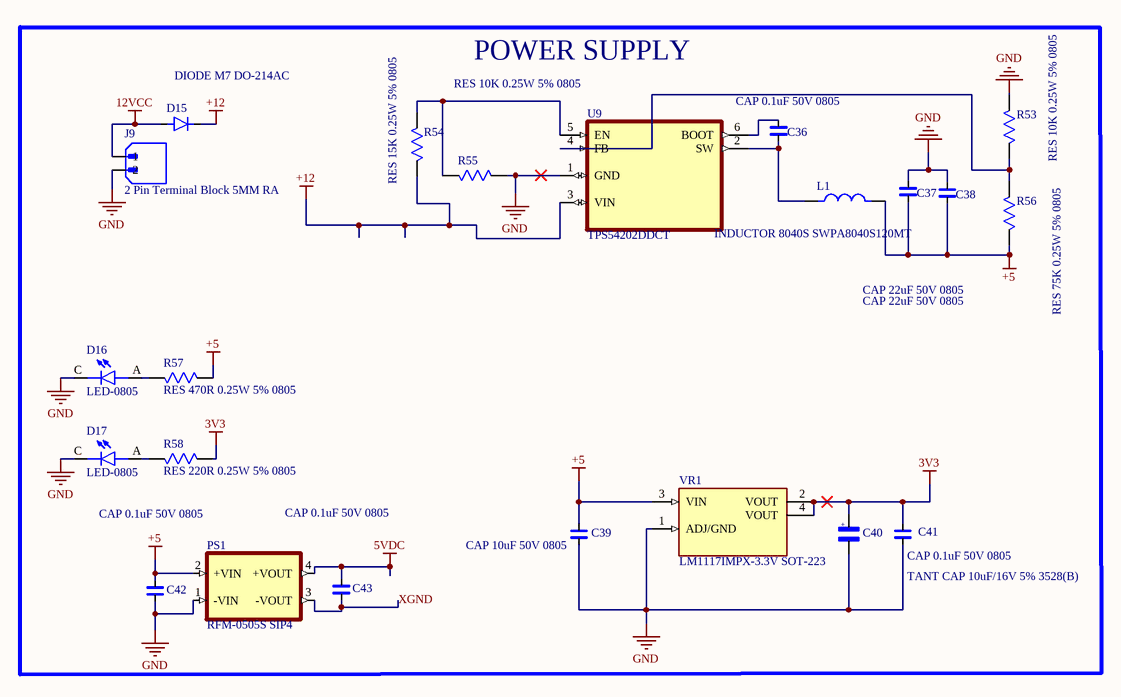
[diagram p2: Power.SchDoc]

### Parts
C36  CAP 0.1uF 50V 0805  [CAP CER 0.1uF/50V 5%]
C37  CAP 22uF 50V 0805  [CAP CER 0.1uF/50V 5%]
C38  CAP 22uF 50V 0805  [CAP CER 0.1uF/50V 5%]
C39  CAP 10uF 50V 0805  [CAP CER 0.1uF/50V 5%]
C40  TANT CAP 10uF/16V 5% 3528(B)  [TANT CAP 3528(B)]
C41  CAP 0.1uF 50V 0805  [CAP CER 0.1uF/50V 5%]
C42  CAP 0.1uF 50V 0805  [CAP CER 0.1uF/50V 5%]
C43  CAP 0.1uF 50V 0805  [CAP CER 0.1uF/50V 5%]
D15  DIODE M7 DO-214AC  [DIODE M7 DO-214AC]
D16  LED-0805  [LED-0805]
D17  LED-0805  [LED-0805]
J9  2 Pin Terminal Block 5MM RA  [2 Pin Terminal Block 5MM RA]
L1  INDUCTOR 8040S SWPA8040S120MT  [INDUCTOR 8040S SWPA8040S120MT]
PS1  RFM-0505S SIP4  [RFM-0505S]
R53  RES 10K 0.25W 5% 0805  [RES 0805 10K/0.25W 5%]
R54  RES 15K 0.25W 5% 0805  [RES 0805 10K/0.25W 5%]
R55  RES 10K 0.25W 5% 0805  [RES 0805 10K/0.25W 5%]
R56  RES 75K 0.25W 5% 0805  [RES 0805 10K/0.25W 5%]
R57  RES 470R 0.25W 5% 0805  [RES 0805 10K/0.25W 5%]
R58  RES 220R 0.25W 5% 0805  [RES 0805 10K/0.25W 5%]
U9  TPS54202DDCT  [SOT95P280X110-6N]
VR1  LM1117IMPX-3.3V SOT-223  [LM1117IMPX-3.3V SOT-223]

### Blocks framed on the sheet
POWER SUPPLY: C36-C43 D15-D17 J9 L1 PS1 R53-R58 U9 VR1

### Nets
3V3: C40.1 C41.2 R58.2 VR1.2(VOUT) VR1.4(VOUT)
5VDC: C43.2 PS1.4(+VOUT)
12VCC: D15.A J9.1
+5: C37.1 C38.1 C39.2 C42.2 L1.2 PS1.2(+VIN) R56.1 R57.2 VR1.3(VIN)
+12: D15.C(K) R54.1 U9.3(VIN)
GND: C37.2 C38.2 C39.1 C40.2 C41.1 C42.1 D16.C D17.C J9.2 PS1.1(-VIN) R53.2 R55.2 U9.1(GND) VR1.1(ADJ/GND)
XGND: C43.1 PS1.3(-VOUT)
NetC36_1: C36.1 L1.1 U9.2(SW)
NetC36_2: C36.2 U9.6(BOOT)
NetD16_A: D16.A R57.1
NetD17_A: D17.A R58.1
NetR53_1: R53.1 R56.2 U9.4(FB)
NetR54_2: R54.2 R55.1 U9.5(EN)

### Notes on the sheet
- (in symbol HOUSTON_LOGO) HOUSTON

### Library data of the parts
C36 C39 C41 = CAP CER 0.1uF/50V 5%: as C1 on sheet main; Purchase-URL: https://pricing.snapeda.com/search?q=CL21B104KCFNNNE&ref=eda; Package: 0805 Samsung; Check_prices: https://www.snapeda.com/parts/CL21B104KCFNNNE/Samsung+Electro-Mechanics/view-part/?ref=eda; Value: *; SnapEDA_Link: https://www.snapeda.com/parts/CL21B104KCFNNNE/Samsung+Electro-Mechanics/view-part/?ref=snap; Digi-Key_Part_Number: 1276-6840-2-ND
C37 C38 = CAP CER 0.1uF/50V 5%: CAP CER 22uF/50V  Ceramic Capacitor X7R 0805 (2012 Metric) SMT; MF: Samsung; MP: CL21B104KCFNNNE; Purchase-URL: https://pricing.snapeda.com/search?q=CL21B104KCFNNNE&ref=eda; Package: 0805 Samsung; Check_prices: https://www.snapeda.com/parts/CL21B104KCFNNNE/Samsung+Electro-Mechanics/view-part/?ref=eda; Value: *; SnapEDA_Link: https://www.snapeda.com/parts/CL21B104KCFNNNE/Samsung+Electro-Mechanics/view-part/?ref=snap; Digi-Key_Part_Number: 1276-6840-2-ND
C40 = TANT CAP 10uF/16V 5% 3528(B): as C9 on sheet main; SnapEDA_Link: https://www.snapeda.com/parts/TCJB106M025R0150/AVX/view-part/?ref=snap; Package: 1210 AVX; Value: *; MP: TCJB106M025R0150; Check_prices: https://www.snapeda.com/parts/TCJB106M025R0150/AVX/view-part/?ref=eda
C42 C43 = CAP CER 0.1uF/50V 5%: CAP CER 0.1uF/50V  Ceramic Capacitor X7R 0805 (2012 Metric); MF: Samsung; MP: CL21B104KCFNNNE; Purchase-URL: https://pricing.snapeda.com/search?q=CL21B104KCFNNNE&ref=eda; Package: 0805 Samsung; Check_prices: https://www.snapeda.com/parts/CL21B104KCFNNNE/Samsung+Electro-Mechanics/view-part/?ref=eda; Value: *; SnapEDA_Link: https://www.snapeda.com/parts/CL21B104KCFNNNE/Samsung+Electro-Mechanics/view-part/?ref=snap; Digi-Key_Part_Number: 1276-6840-2-ND
D15 = DIODE M7 DO-214AC: as D2 on sheet main; SnapEDA_Link: https://www.snapeda.com/parts/RS2MA/Taiwan+Semiconductor/view-part/?ref=snap; Package: DO-214AC-2 Taiwan Semiconductor; Value: *; MP: RS2MA; Check_prices: https://www.snapeda.com/parts/RS2MA/Taiwan+Semiconductor/view-part/?ref=eda
D16 D17 = LED-0805: as D1 on sheet main; SnapEDA_Link: https://www.snapeda.com/parts/APT2012SRCPRV/Kingbright/view-part/?ref=snap; Package: 0805 Kingbright; Value: *; MP: APT2012SRCPRV; Check_prices: https://www.snapeda.com/parts/APT2012SRCPRV/Kingbright/view-part/?ref=eda
J9 = 2 Pin Terminal Block 5MM RA: 2 Pin Terminal Block HDR 5MM THT RA _OQ0271510000G; MF: Amphenol Anytek; SnapEDA_Link: https://www.snapeda.com/parts/OQ0271510000G/Amphenol/view-part/?ref=snap; Package: None; Value: *; MP: OQ0271510000G; Check_prices: https://www.snapeda.com/parts/OQ0271510000G/Amphenol/view-part/?ref=eda
L1 = INDUCTOR 8040S SWPA8040S120MT: SWPA8040S120MT SMD 8.0×8.0x4.0mm 8040S 12uH Â±20% 2.8A 142 mOhm SMT Shielded Wirewound Inductor; MF: Abracon LLC; MP: ASPI-8040S-510M-T; Purchase-URL: https://pricing.snapeda.com/search/part/ASPI-8040S-510M-T/?ref=eda; Value: *; SnapEDA_Link: https://www.snapeda.com/parts/ASPI-8040S-510M-T/Abracon+LLC/view-part/?ref=snap; Package: Nonstandard Abracon LLC; Check_prices: https://www.snapeda.com/parts/ASPI-8040S-510M-T/Abracon+LLC/view-part/?ref=eda; Availability: In Stock; Price: None
PS1 = RFM-0505S: DC-DC Converter/Isolator, SIP4, 1kV unreg, Single Output, 1W, 5V Out, RFM Series | RECOM Power Inc. RFM-0505S; SnapEDA_Link: https://www.snapeda.com/parts/RFM-0505S/Recom+Power/view-part/?ref=snap; Package: SIP-4 Recom Power; Value: *; MF: Recom Power; MP: RFM-0505S; Check_prices: https://www.snapeda.com/parts/RFM-0505S/Recom+Power/view-part/?ref=eda
R53 R55 R57 R58 = RES 10K 0.25W 5% 0805: as R1 on sheet main; Price: None; Check_prices: https://www.snapeda.com/parts/ERJ-6GEYJ103V/Panasonic+Electronic+Components/view-part/?ref=eda; Package: 805-2 Panasonic; Purchase-URL: https://pricing.snapeda.com/search/part/ERJ-6GEYJ103V/?ref=eda; Availability: In Stock; SnapEDA_Link: https://www.snapeda.com/parts/ERJ-6GEYJ103V/Panasonic+Electronic+Components/view-part/?ref=snap; Value: *
R54 = RES 10K 0.25W 5% 0805: RESISTOR, THICK FILM, 15K, 5%, 0805 0.25W SMT; MP: ERJ-6GEYJ103V; MF: Panasonic Electronic; Price: None; Check_prices: https://www.snapeda.com/parts/ERJ-6GEYJ103V/Panasonic+Electronic+Components/view-part/?ref=eda; Package: 805-2 Panasonic; Purchase-URL: https://pricing.snapeda.com/search/part/ERJ-6GEYJ103V/?ref=eda; Availability: In Stock; SnapEDA_Link: https://www.snapeda.com/parts/ERJ-6GEYJ103V/Panasonic+Electronic+Components/view-part/?ref=snap; Value: *
R56 = RES 10K 0.25W 5% 0805: RESISTOR, THICK FILM, 75K, 5%, 0805 0.25W SMT; MP: ERJ-6GEYJ103V; MF: Panasonic Electronic; Price: None; Check_prices: https://www.snapeda.com/parts/ERJ-6GEYJ103V/Panasonic+Electronic+Components/view-part/?ref=eda; Package: 805-2 Panasonic; Purchase-URL: https://pricing.snapeda.com/search/part/ERJ-6GEYJ103V/?ref=eda; Availability: In Stock; SnapEDA_Link: https://www.snapeda.com/parts/ERJ-6GEYJ103V/Panasonic+Electronic+Components/view-part/?ref=snap; Value: *
U9 = TPS54202DDCT: 4.5V to 28V Input, 2A Output, EMI Friendly Synchronous Step-Down Converter; MF: Texas Instruments; SnapEDA_Link: https://www.snapeda.com/parts/TPS54202DDCT/Texas+Instruments/view-part/?ref=snap; Package: SOT-23-THN-6 Texas Instruments; Value: *; MP: TPS54202DDCT; Check_prices: https://www.snapeda.com/parts/TPS54202DDCT/Texas+Instruments/view-part/?ref=eda
VR1 = LM1117IMPX-3.3V SOT-223: LM1117IMPX-3.3V 800-mA 15-V linear voltage regulator SOT-223; MF: Texas Instruments; MP: LM1117IMPX-5.0/NOPB; SnapEDA_Link: https://www.snapeda.com/parts/LM1117IMPX-5.0/NOPB/Texas+Instruments/view-part/?ref=snap; Package: SOT-223-4 Texas Instruments; Value: *; Check_prices: https://www.snapeda.com/parts/LM1117IMPX-5.0/NOPB/Texas+Instruments/view-part/?ref=eda

## Nets that join several sheets
3V3: main (25 pins), LAN 485 (10 pins), Power (5 pins)
5VDC: main (R13.1 R20.1), Power (C43.2 PS1.4)
12VCC: main (R1.1 R9.1), Power (D15.A J9.1)
+5: main (8 pins), LAN 485 (7 pins), Power (9 pins)
GND: main (36 pins), LAN 485 (34 pins), Power (14 pins)
DI_TX1: main (U1.16), LAN 485 (R49.1 U7.5)
MISO: main (U1.56), LAN 485 (U6.34)
MOSI: main (U1.57), LAN 485 (U6.35)
RO_RX1: main (U1.17), LAN 485 (U7.4)
RST: main (U1.21), LAN 485 (R30.1 U6.37)
SCS: main (U1.58), LAN 485 (R28.1 U6.32)
SWO/sck1: main (U1.55), LAN 485 (U6.33)
XGND: main (CON1.3 CON2.3 R17.1 R26.1), Power (C43.1 PS1.3)